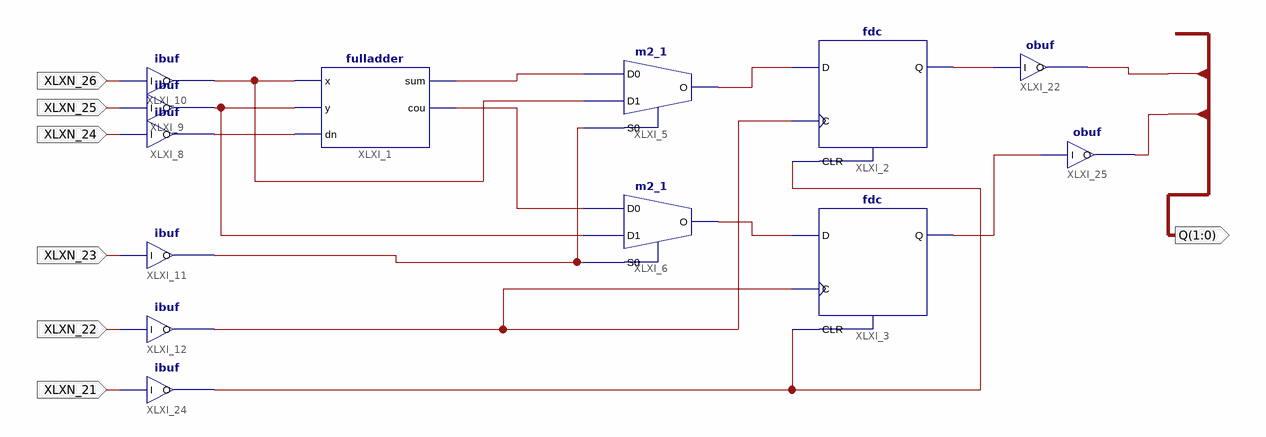
[diagram p0: schematic sheet 1]
// Xilinx ISE schematic erg2.sch (spartan3) as structural Verilog: 13 symbols, 7 ports
module erg2 (
  input  XLXN_21,
  input  XLXN_22,
  input  XLXN_23,
  input  XLXN_24,
  input  XLXN_25,
  input  XLXN_26,
  output [1:0] Q
);

  wire XLXN_5, XLXN_7, XLXN_8, XLXN_9, XLXN_10, XLXN_12, XLXN_13, XLXN_14, XLXN_16, XLXN_17, XLXN_18, XLXN_34;

  fulladder XLXI_1 (.cou(XLXN_10), .dn(XLXN_7), .sum(XLXN_9), .x(XLXN_5), .y(XLXN_8));
  fdc XLXI_2 (.C(XLXN_13), .CLR(XLXN_14), .D(XLXN_16), .Q(XLXN_18));
  fdc XLXI_3 (.C(XLXN_13), .CLR(XLXN_14), .D(XLXN_17), .Q(XLXN_34));
  m2_1 XLXI_5 (.D0(XLXN_9), .D1(XLXN_5), .S0(XLXN_12), .O(XLXN_16));
  m2_1 XLXI_6 (.D0(XLXN_10), .D1(XLXN_8), .S0(XLXN_12), .O(XLXN_17));
  ibuf XLXI_8 (.I(XLXN_24), .O(XLXN_7));
  ibuf XLXI_9 (.I(XLXN_25), .O(XLXN_8));
  ibuf XLXI_10 (.I(XLXN_26), .O(XLXN_5));
  ibuf XLXI_11 (.I(XLXN_23), .O(XLXN_12));
  ibuf XLXI_12 (.I(XLXN_22), .O(XLXN_13));
  obuf XLXI_22 (.I(XLXN_18), .O(Q[0]));
  ibuf XLXI_24 (.I(XLXN_21), .O(XLXN_14));
  obuf XLXI_25 (.I(XLXN_34), .O(Q[1]));
endmodule
